# Altium schematic sheet Power_Management.SchDoc
size 420 x 297 mm; SheetNumber: 3; SheetTotal: 5
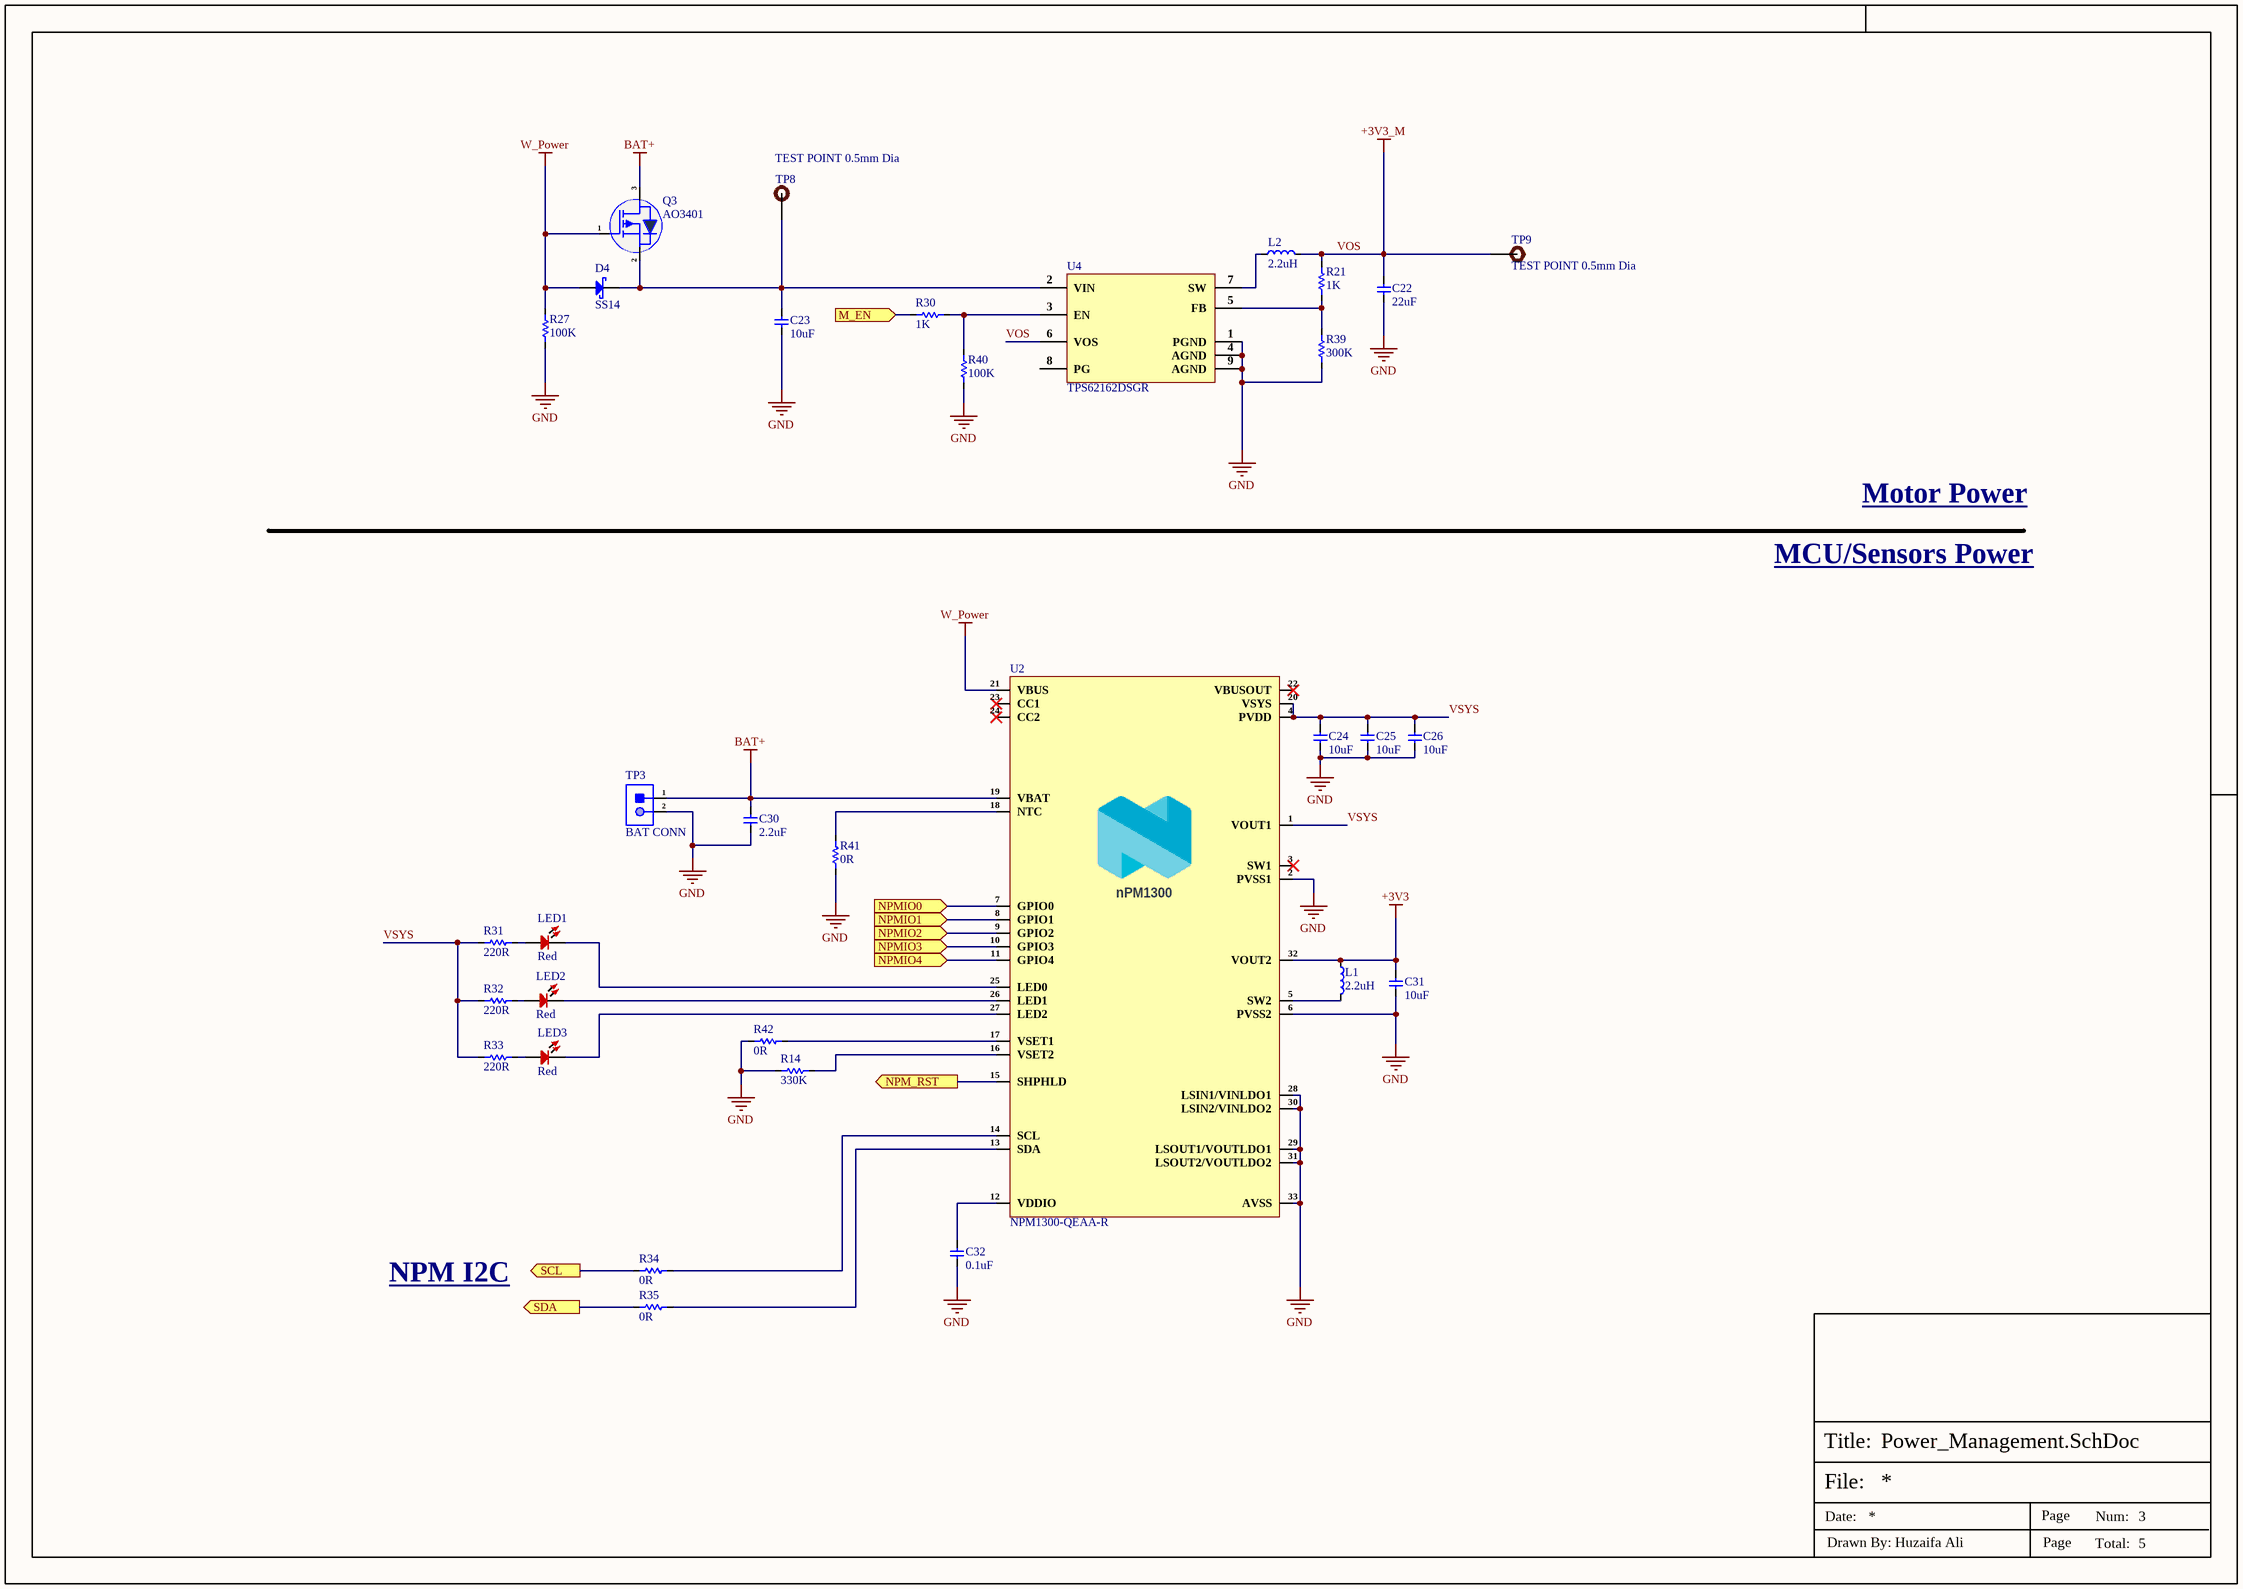
[diagram p0: Power_Management.SchDoc]

## Parts
C22  22uF  [Cap-0402]
C23  10uF  [Cap-0402]
C24  10uF  [Cap-0402]
C25  10uF  [Cap-0402]
C26  10uF  [Cap-0402]
C30  2.2uF  [Cap-0402]
C31  10uF  [Cap-0402]
C32  0.1uF  [Cap-0402]
D4  SS14  [SMA(DO-214AC)]
L1  2.2uH  [MAKK2016T2R2M_]
L2  2.2uH  [NR3015T2R2M]
LED1  Red  [LED-0402]
LED2  Red  [LED-0402]
LED3  Red  [LED-0402]
Q3  AO3401  [SOT-23]
R14  330K  [Res-0402]
R21  1K  [Res-0402]
R27  100K  [Res-0402]
R30  1K  [Res-0402]
R31  220R  [Res-0402]
R32  220R  [Res-0402]
R33  220R  [Res-0402]
R34  0R  [Res-0402]
R35  0R  [Res-0402]
R39  300K  [Res-0402]
R40  100K  [Res-0402]
R41  0R  [Res-0402]
R42  0R  [Res-0402]
TP3  BAT CONN  [2 Test Pad]  (no BOM)
TP8  TEST POINT 0.5mm Dia  [Test-point - 0.5mm]  (no BOM)
TP9  TEST POINT 0.5mm Dia  [Test-point - 0.5mm]  (no BOM)
U2  NPM1300-QEAA-R  [32-QFN (5x5)]
U4  TPS62162DSGR  [8-WSON(2x2)]

## Ports
M_EN (in, see MCU[3B]), NPM_RST (out, see MCU[4C]), NPMIO0 (in, see MCU[4B]), NPMIO1 (in, see MCU[4C]), NPMIO2 (in, see MCU[4C]), NPMIO3 (in, see MCU[4C]), NPMIO4 (in, see MCU[4B]), SCL (out, see IMU[3C], MCU[4B]), SDA (out, see IMU[3C], MCU[4B])

## Nets
+3V3: C31.2 L1.1 U2.32(VOUT2)
BAT+: C30.2 Q3.3(D) TP3.1 U2.19(VBAT)
GND: C22.1 C23.1 C24.1 C25.1 C26.1 C30.1 C31.1 C32.1 R14.1 R27.1 R39.1 R40.2 R41.1 R42.1 TP3.2 U2.2(PVSS1) U2.6(PVSS2) U2.28(LSIN1/VINLDO1) U2.29(LSOUT1/VOUTLDO1) U2.30(LSIN2/VINLDO2) U2.31(LSOUT2/VOUTLDO2) U2.33(AVSS) U4.1(PGND) U4.4(AGND) U4.9(AGND)
VOS: C22.2 L2.2 R21.2 TP9.1 U4.6(VOS)  [also labelled +3V3_M]
W_Power: D4.2(A) Q3.1(G) R27.2 U2.21(VBUS)
M_EN: R30.1 ; port M_EN
NPM_RST: U2.15(SHPHLD) ; port NPM_RST
NPMIO0: U2.7(GPIO0) ; port NPMIO0
NPMIO1: U2.8(GPIO1) ; port NPMIO1
NPMIO2: U2.9(GPIO2) ; port NPMIO2
NPMIO3: U2.10(GPIO3) ; port NPMIO3
NPMIO4: U2.11(GPIO4) ; port NPMIO4
SCL: R34.1 ; port SCL
SDA: R35.1 ; port SDA
VSYS: C24.2 C25.2 C26.2 R31.2 R32.2 R33.2 U2.1(VOUT1) U2.4(PVDD) U2.20(VSYS)
NetC23_2: C23.2 D4.1(K) Q3.2(S) TP8.1 U4.2(VIN)
NetC32_2: C32.2 U2.12(VDDIO)
NetL1_2: L1.2 U2.5(SW2)
NetL2_1: L2.1 U4.7(SW)
NetLED1_1: LED1.1 R31.1
NetLED1_2: LED1.2 U2.25(LED0)
NetLED2_1: LED2.1 R32.1
NetLED2_2: LED2.2 U2.26(LED1)
NetLED3_1: LED3.1 R33.1
NetLED3_2: LED3.2 U2.27(LED2)
NetR14_2: R14.2 U2.16(VSET2)
NetR21_1: R21.1 R39.2 U4.5(FB)
NetR30_2: R30.2 R40.1 U4.3(EN)
NetR34_2: R34.2 U2.14(SCL)
NetR35_2: R35.2 U2.13(SDA)
NetR41_2: R41.2 U2.18(NTC)
NetR42_2: R42.2 U2.17(VSET1)

Not connected (* = marked no-connect by the designer): U2 3(SW1)* 22(VBUSOUT)* 23(CC1)* 24(CC2)*; U4 8(PG)

## Notes on the sheet
- Motor Power
- MCU/Sensors Power
- NPM I2C
- File:
- Title:
- Date:
- Page
- Num:
- Total:
- Drawn By: Huzaifa Ali
- (in symbol NPM1300-QEAA-R) nPM1300

## Library data of the parts
C22 = GRM158R61A226ME15D: CAP CER 22UF 10V X5R 0402; Manufacturer: Murata; Material: 4241ConductorMaterial; Dielectric: 1537DielectricType; Tolerance: 20%; Item Type: Capacitor; Supplier: Mouser; Supplier Part Number: 81-GRM158R61A226ME5D; Manufacturer Part Number: GRM158R61A226ME15D; RoHS: Yes; Stock: 328944; Pricing: 1=0.46, 10=0.225, 50=0.225, 100=0.146, 1000=0.124, 10000=0.106 (USD); Case/Package: 343Case; Min Operating Temperature: -55°C; Max Operating Temperature: 85°C; Value: 22uF; Voltage Rating: 10V; Voltage Rating (DC): 10V; Length: 1mm; Width: 500um; Height: 800um; Thickness: 800um; LCSC Part Number: C3845593; Category: Ceramic Capacitors
C23-C26 C31 = CC0402MRX5R6BB106: CAP CER 10UF 10V X5R 0402; Manufacturer: Yageo; Tolerance: 20%; Item Type: Capacitor; Supplier 1: Future Electronics; Manufacturer Part Number: CC0402MRX5R6BB106; RoHS: Yes; Category: Ceramic Capacitors; Stock 1: 80000; Pricing 1: 10000=0.02650, 20000=0.02590, 30000=0.02550, 40000=0.02530, 50000=0.02450 (USD); Mount: Surface Mount; Case/Package: 0402; Case Code (Imperial): 0402; Case Code (Metric): 1005; Min Operating Temperature: -55°C; Max Operating Temperature: 85°C; Packaging: Tape and Reel; Capacitance: 10uF; Voltage Rating: 10V; RoHS Compliant: Yes; ComponentLink1URL: http://www.yageo.com/documents/recent/UPY-GPHC_X5R_4V-to-50V_25.pdf?src-supplier=Digi-Key; ComponentLink1Description: http://www.yageo.com/documents/recent/UPY-GPHC_X5R_4V-to-50V_25.pdf?src-supplier=Digi-Key; Supplier Part Number 1: 6097631; LCSC Part Number: C962143
C30 = C1005X5R1V225K050BC: CAP CER 2.2UF 35V X5R 0402; Manufacturer: TDK; Item Type: Capacitors; Dielectric Material: Ceramic; Material: 4241ConductorMaterial; Tolerance: 10%; Supplier: Digikey; Supplier Part Number: 445-9028-1-ND; Manufacturer Part Number: C1005X5R1V225K050BC; RoHS: Yes; Stock: 1458755; Pricing: 1=0.21, 10=0.123, 50=0.0866, 100=0.0754, 500=0.05646, 1000=0.05055, 2500=0.04429, 5000=0.04049 (USD); Mounting Technology: Surface Mount; Case/Package: 0402; Case Code (Imperial): 0402; Case Code (Metric): 1005; Weight: 2.3E-05oz; Min Operating Temperature: -55°C; Max Operating Temperature: 85°C; Packaging: Tape and Reel; Voltage Rating: 35V; Value: 2.2uF; Voltage Rating (DC): 35V; Package Quantity: 1; Dielectric: X5R; Termination: SMD/SMT; Series: C; Length: 1mm; Width: 0.02inch; Height: 0.5mm; Thickness: 0.022inch; Depth: 0.5mm; Lead Free: Lead Free; RoHS Compliant: Yes; Reach SVHC Compliant: Unknown; ComponentLink1URL: https://datasheet.ciiva.com/24218/mlcc-commercial-general-en-24218938.pdf?src-supplier=Mouser; ComponentLink1Description: https://datasheet.ciiva.com/24218/mlcc-commercial-general-en-24218938.pdf?src-supplier=Mouser
C32 = C1005X5R1H104K050BB: CAP CER 0.1UF 50V X5R 0402; Manufacturer: TDK; Dielectric Material: Ceramic; Capacitance: 100nF; Tolerance: 10%; Item Type: Capacitor; Supplier 1: Digi-Key; Manufacturer Part Number: C1005X5R1H104K050BB; Stock 1: 1455182; Pricing 1: 1=0.12, 10=0.09, 50=0.049, 100=0.04, 500=0.02858, 1000=0.02245, 2500=0.02041, 5000=0.01878 (USD); Mount: Surface Mount; Case/Package: 0402; Case Code (Metric): 1005; Case Code (Imperial): 0402; Weight: 2.3E-05oz; Min Operating Temperature: -55°C; Max Operating Temperature: 85°C; Dielectric: X5R; Voltage Rating: 50V; Packaging: Tape and Reel; Voltage Rating (DC): 50V; Termination: SMD/SMT; Construction: Flat; Package Quantity: 1; Resistor Type: Ceramic; Voltage: 50V; Series: C; Length: 1mm; Width: 0.02inch; Height: 0.5mm; Depth: 0.5mm; Thickness: 0.022inch; Radiation Hardening: No; Lead Free: Lead Free; REACH SVHC: No SVHC; RoHS Compliant: Yes; ComponentLink1URL: https://product.tdk.com/info/en/catalog/spec/mlccspec_commercial_general_midvoltage_en.pdf?src-supplier=Digi-Key; ComponentLink1Description: https://product.tdk.com/info/en/catalog/spec/mlccspec_commercial_general_midvoltage_en.pdf?src-supplier=Digi-Key; ComponentLink2URL: http://www.tdk.co.jp/tefe02/e413_c.pdf?src-supplier=Future+Electronics; ComponentLink2Description: http://www.tdk.co.jp/tefe02/e413_c.pdf?src-supplier=Future+Electronics; ComponentLink3URL: https://www.verical.com/server-webapp/html/getDatasheet?partID=743571&src-supplier=Verical; ComponentLink3Description: https://www.verical.com/server-webapp/html/getDatasheet?partID=743571&src-supplier=Verical; ComponentLink4URL: http://www.tdk.co.jp/tefe02/e412_c.pdf?src-supplier=Avnet+Europe; ComponentLink4Description: http://www.tdk.co.jp/tefe02/e412_c.pdf?src-supplier=Avnet+Europe; Supplier Part Number 1: 445-5942-1-ND; LCSC Part Number: C2181865
D4 = SS14: 40V Independent Type 1A 550mV@1A SMA(DO-214AC) Schottky Diodes ROHS; Manufacturer: MDD(Microdiode Semiconductor); Item Type: Diode; Manufacturer Part Number: SS14; Package: SMA(DO-214AC); LCSC Part Number: C2480; ComponentLink1Description: LCSC; ComponentLink1URL: https://www.lcsc.com/product-detail/Schottky-Diodes_MDD-Microdiode-Semiconductor-SS14_C2480.html?s_z=n_C2480
L1 = MAKK2016T2R2M: FIXED IND 2.2UH 1.5A 160MOHM SMD; Manufacturer: Taiyo Yuden; Core Material: Metal; Tolerance: 20%; Shielding: Shielded; DC Resistance (DCR): 160mR; Test Frequency: 2MHz; Item Type: Inductor; Supplier 1: Mouser; Manufacturer Part Number: MAKK2016T2R2M; RoHS: Yes; Category: Fixed Inductors; Stock 1: 64320; Pricing 1: 1=0.27000, 10=0.17200, 50=0.17200, 100=0.14000, 1000=0.10600, 10000=0.09200 (USD); Mount: Surface Mount; Case/Package: 0806; Case Code (Metric): 2016; Case Code (Imperial): 0806; Min Operating Temperature: -40°C; Max Operating Temperature: 105°C; Packaging: Tape and Reel; Package Quantity: 3000; Resistor Type: Wirewound; Inductance: 2.2uH; Current Rating: 1.5A; Saturation Current: 1.5A; Max DC Current: 1.5A; Termination: SMD/SMT; Length: 0.079inch; Width: 0.063inch; Height: 1mm; Height - Seated (Max): 0.039inch; Depth: 1.6mm; Radiation Hardening: No; Halogen Free: Halogen Free; RoHS Compliant: Yes; ComponentLink1URL: https://datasheet.ciiva.com/30014/makk2016t2r2m-ss-30014449.pdf?src-supplier=Avnet; ComponentLink1Description: https://datasheet.ciiva.com/30014/makk2016t2r2m-ss-30014449.pdf?src-supplier=Avnet; Supplier Part Number 1: 963-MAKK2016T2R2M; LCSC Part Number: C92923
L2 = NR3015T2R2M: FIXED IND 2.2UH 1.5A 72 MOHM SMD; Manufacturer: Taiyo Yuden; Item Type: Inductor; Core Material: Ferrite; Self Resonant Frequency: 64MHz; Shielding: Shielded; Current Rating: 1.48A; Inductance Tolerance: 20%; DC Resistance (DCR): 72mR; Test Frequency: 100kHz; Supplier: Digikey; LCSC Part Number: C86423; Manufacturer Part Number: NR3015T2R2M; RoHS: Yes; Stock: 131557; Pricing: 1=0.32, 10=0.263, 25=0.2424, 50=0.2222, 100=0.1959, 250=0.18988, 500=0.16968, 1000=0.13736 (USD); Case/Package: 3015; Pins: 2; Min Operating Temperature: -25°C; Max Operating Temperature: 120°C; Packaging: Tape and Reel; Value: 2.2uH; Package Quantity: 1; Saturation Current: 1.48A; Tolerance: 20%; Max DC Current: 1.5A; Termination: SMD/SMT; RMS Current (Irms): 1.5A; Series: NR; ESR: 72mR; Length: 0.118inch; Width: 0.118inch; Height: 1.5mm; Height - Seated (Max): 0.059inch; Halogen Free: Halogen Free; Lead Free: Lead Free; Reach SVHC Compliant: Unknown; RoHS Compliant: Yes; ComponentLink1URL: https://datasheet.ciiva.com/8002/1734585-8002131.pdf?src-supplier=Element14; ComponentLink1Description: https://datasheet.ciiva.com/8002/1734585-8002131.pdf?src-supplier=Element14; ComponentLink2URL: https://datasheet.ciiva.com/8002/nr3015t2r2m-ss-8002130.pdf?src-supplier=Element14; ComponentLink2Description: https://datasheet.ciiva.com/8002/nr3015t2r2m-ss-8002130.pdf?src-supplier=Element14; ComponentLink3URL: https://datasheet.ciiva.com/8499/nr3015t2r2m-ss-8499257.pdf?src-supplier=Avnet; ComponentLink3Description: https://datasheet.ciiva.com/8499/nr3015t2r2m-ss-8499257.pdf?src-supplier=Avnet; ComponentLink4URL: https://datasheet.ciiva.com/15988/279nr3015t2r2m-15988078.pdf?src-supplier=Onlinecomponents.com; ComponentLink4Description: https://datasheet.ciiva.com/15988/279nr3015t2r2m-15988078.pdf?src-supplier=Onlinecomponents.com; ComponentLink5URL: https://datasheet.ciiva.com/1043/wound04-e-1043235.pdf?src-supplier=Digikey; ComponentLink5Description: https://datasheet.ciiva.com/1043/wound04-e-1043235.pdf?src-supplier=Digikey; ComponentLink6URL: https://datasheet.ciiva.com/1043/wound04-e-1043234.pdf?src-supplier=Digikey; ComponentLink6Description: https://datasheet.ciiva.com/1043/wound04-e-1043234.pdf?src-supplier=Digikey; ComponentLink7URL: https://datasheet.ciiva.com/1043/wound04-e-1043236.pdf?src-supplier=Digikey; ComponentLink7Description: https://datasheet.ciiva.com/1043/wound04-e-1043236.pdf?src-supplier=Digikey
LED1-LED3 = XZMDK68W-2: LED RED CLEAR CHIP SMD; Manufacturer: SunLED; Lens Color: Colorless; Luminous Intensity: 69mcd; Test Current: 20mA; Viewing Angle: 120°; Dominant Wavelength: 630nm; Forward Voltage: 1.95V; Supplier 1: Digi-Key; Manufacturer Part Number: XZMDK68W-2; Stock 1: 69539; Pricing 1: 1=0.43, 10=0.306, 100=0.136, 500=0.0952, 1000=0.0782 (USD); Mount: Surface Mount; Case/Package: 0402; Color: Red; Case Code (Metric): 1005; Case Code (Imperial): 0402; Packaging: Tape and Reel; Lens Transparency: Clear; Length: 1mm; Height: 0.6mm; Width: 0.5mm; ComponentLink1URL: http://www.sunledusa.com/products/spec/XZMDK68W-2.pdf?src-supplier=Digi-Key; ComponentLink1Description: http://www.sunledusa.com/products/spec/XZMDK68W-2.pdf?src-supplier=Digi-Key; ComponentLink2URL: https://www.sunledusa.com/products/spec/XZMDK68W-2.pdf?src-supplier=Digi-Key; ComponentLink2Description: https://www.sunledusa.com/products/spec/XZMDK68W-2.pdf?src-supplier=Digi-Key; Supplier Part Number 1: 1497-1174-6-ND; Item Type: LED
Q3 = AO3401: Trans Mosfet P-ch 30V 4A 3-PIN SOT-23 T/r; Manufacturer: Alpha & Omega Semiconductor; Manufacturer Part Number: AO3401A; Rds On Max: 44mR; Input Capacitance: 1.2nF; Max Power Dissipation: 1.4W; Number of Elements: 1; Supplier 1: Arrow Electronics; RoHS: Yes; Category: MOSFETs; Mount: Surface Mount; Case/Package: TO-236-3; Number of Pins: 3; Min Operating Temperature: -55°C; Max Operating Temperature: 150°C; Packaging: Tape and Reel; Drain to Source Voltage (Vdss): 30V; Continuous Drain Current (ID): 4A; Power Dissipation: 1.4W; Series: -; Radiation Hardening: No; RoHS Compliant: Yes; Lead Free: Lead Free; ComponentLink1URL: https://datasheet.ciiva.com/940/ao3401a-940720.pdf?src-supplier=Digi-Key; ComponentLink1Description: https://datasheet.ciiva.com/940/ao3401a-940720.pdf?src-supplier=Digi-Key; ComponentLink2URL: https://datasheet.ciiva.com/26927/getdatasheetpartid-79048-26927888.pdf?src-supplier=Verical; ComponentLink2Description: https://datasheet.ciiva.com/26927/getdatasheetpartid-79048-26927888.pdf?src-supplier=Verical; Supplier Part Number 1: AO3401A; LCSC Part Number: C181091; Item Type: Mosfet
R14 = CRCW0402330KFKEDC: RES 330K OHM 1% 1/16W 0402; Manufacturer: Vishay; Power Rating: 63mW; Value: 330kR; Item Type: Resistor; Supplier: Mouser; Supplier Part Number: 71-CRCW0402330KFKEDC; Manufacturer Part Number: CRCW0402330KFKEDC; RoHS: Yes; Category: Chip SMD Resistors; Stock: 34154; Pricing: 1=0.1, 10=0.017, 50=0.017, 100=0.008, 1000=0.005, 10000=0.004 (USD); Case/Package: 0402; Tolerance: 1%; Lead Free: Lead Free; RoHS Compliant: Yes; LCSC Part Number: C3009051
R21 R30 = CRCW04021K00JNED: RES SMD 1K OHM 5% 1/16W 0402; Manufacturer: Vishay Dale; Item Type: Resistors; Power Rating: 63mW; Value: 1kR; Temperature Coefficient: 200ppm/°C; Voltage Rating: 50V; Supplier: Mouser; LCSC Part Number: C191588; Manufacturer Part Number: CRCW04021K00JNED; RoHS: Yes; Stock: 2955; Pricing: 1=0.1, 10=0.016, 50=0.016, 100=0.012, 1000=0.007, 10000=0.003 (USD); Case/Package: 0402; Pins: 2; Case Code (Imperial): 0402; Case Code (Metric): 1005; Weight: 2.3E-05oz; Contact Plating: Tin; Min Operating Temperature: -55°C; Max Operating Temperature: 155°C; Packaging: Tape and Reel; Tolerance: 5%; Package Quantity: 1; Termination: SMD/SMT; Number of Terminations: 2; Max Power Dissipation: 63mW; Features: Automotive AEC-Q200; Series: CRCW; Technology: THICK FILM; Resistor Type: Thick Film; Working Voltage: 50V; Resistance Tolerance: 5%; Construction: Rectangular; Voltage Rating (DC): 50V; Length: 1mm; Width: 0.02inch; Height: 0.016inch; Depth: 0.5mm; Ratings: AEC-Q200; Radiation Hardening: No; Lead Free: 5697LeadFree; RoHS Compliant: Yes; Military Standard: Not; Reach SVHC Compliant: Unknown; ComponentLink1URL: https://datasheet.ciiva.com/28621/1847332-28621342.pdf?src-supplier=Element14; ComponentLink1Description: https://datasheet.ciiva.com/28621/1847332-28621342.pdf?src-supplier=Element14; ComponentLink2URL: https://datasheet.ciiva.com/2462/dcrcwe3-2462077.pdf?src-supplier=Digikey; ComponentLink2Description: https://datasheet.ciiva.com/2462/dcrcwe3-2462077.pdf?src-supplier=Digikey; ComponentLink3URL: https://datasheet.ciiva.com/2462/dcrcwe3-2462078.pdf?src-supplier=Digikey; ComponentLink3Description: https://datasheet.ciiva.com/2462/dcrcwe3-2462078.pdf?src-supplier=Digikey; ComponentLink4URL: https://datasheet.ciiva.com/16199/dcrcwe3-16199256.pdf?src-supplier=Future+Electronics; ComponentLink4Description: https://datasheet.ciiva.com/16199/dcrcwe3-16199256.pdf?src-supplier=Future+Electronics; ComponentLink5URL: https://datasheet.ciiva.com/2462/dcrcwe3-2462076.pdf?src-supplier=Digikey; ComponentLink5Description: https://datasheet.ciiva.com/2462/dcrcwe3-2462076.pdf?src-supplier=Digikey; ComponentLink6URL: https://datasheet.ciiva.com/7743/dcrcwe3-7743478.pdf?src-supplier=Element14; ComponentLink6Description: https://datasheet.ciiva.com/7743/dcrcwe3-7743478.pdf?src-supplier=Element14; ComponentLink7URL: https://datasheet.ciiva.com/16778/70201119-16778053.pdf?src-supplier=Allied+Electronics; ComponentLink7Description: https://datasheet.ciiva.com/16778/70201119-16778053.pdf?src-supplier=Allied+Electronics; ComponentLink8URL: https://datasheet.ciiva.com/5545/dcrcwe3-109170-5545913.pdf?src-supplier=Mouser; ComponentLink8Description: https://datasheet.ciiva.com/5545/dcrcwe3-109170-5545913.pdf?src-supplier=Mouser
R27 R40 = RC0402FR-07100KL: RES 100K OHM 1% 1/16W 0402; Manufacturer: Yageo; Resistance: 100kR; Temperature Coefficient: 100ppm/°C; Power Rating: 63mW; Voltage Rating: 50V; Item Type: Resistor; Supplier 1: Mouser; Manufacturer Part Number: RC0402FR-07100KL; RoHS: Yes; Category: Chip SMD Resistors; Stock 1: 7759549; Pricing 1: 1=0.10000, 10=0.01200, 50=0.01200, 100=0.00500, 1000=0.00300, 2500=0.00200, 10000=0.00100 (USD); Case/Package: 0402; Case Code (Metric): 1005; Case Code (Imperial): 0402; Min Operating Temperature: -55°C; Max Operating Temperature: 155°C; Resistor Type: Thick Film; Tolerance: 1%; Packaging: Tape and Reel; Package Quantity: 1; Number of Terminations: 2; Termination: SMD/SMT; Max Power Dissipation: 63mW; Working Voltage: 50V; Features: Moisture Resistant; Series: RC; Resistance Tolerance: 1%; Construction: Rectangular; Technology: THICK FILM; Length: 0.039inch; Width: 0.02inch; Height: 0.016inch; Depth: 0.5mm; REACH SVHC: No SVHC; Lead Free: Lead Free; RoHS Compliant: Yes; Military Standard: Not; ComponentLink1URL: https://datasheet.ciiva.com/11819/0900766b80c66297-11819452.pdf?src-supplier=RSComponents; ComponentLink1Description: https://datasheet.ciiva.com/11819/0900766b80c66297-11819452.pdf?src-supplier=RSComponents; ComponentLink2URL: https://datasheet.ciiva.com/22747/1018594-22747509.pdf?src-supplier=Element14; ComponentLink2Description: https://datasheet.ciiva.com/22747/1018594-22747509.pdf?src-supplier=Element14; ComponentLink3URL: https://datasheet.ciiva.com/2453/pyu-r-int-thick-7-2453362.pdf?src-supplier=Digi-Key; ComponentLink3Description: https://datasheet.ciiva.com/2453/pyu-r-int-thick-7-2453362.pdf?src-supplier=Digi-Key; ComponentLink4URL: https://datasheet.ciiva.com/2453/pyu-r-int-thick-7-2453363.pdf?src-supplier=Digi-Key; ComponentLink4Description: https://datasheet.ciiva.com/2453/pyu-r-int-thick-7-2453363.pdf?src-supplier=Digi-Key; ComponentLink5URL: https://datasheet.ciiva.com/2453/pyu-r-int-thick-7-2453361.pdf?src-supplier=Digi-Key; ComponentLink5Description: https://datasheet.ciiva.com/2453/pyu-r-int-thick-7-2453361.pdf?src-supplier=Digi-Key; ComponentLink6URL: https://datasheet.ciiva.com/12667/pyu-rc0402-51-rohs-l-6-r-12667930.pdf?src-supplier=Mouser; ComponentLink6Description: https://datasheet.ciiva.com/12667/pyu-rc0402-51-rohs-l-6-r-12667930.pdf?src-supplier=Mouser; ComponentLink7URL: https://datasheet.ciiva.com/15189/getdatasheetpartid-323696-15189334.pdf?src-supplier=Verical; ComponentLink7Description: https://datasheet.ciiva.com/15189/getdatasheetpartid-323696-15189334.pdf?src-supplier=Verical; Supplier Part Number 1: 603-RC0402FR-07100KL; LCSC Part Number: C60491
R31-R33 = RC0402FR-07220RL: RES 220 OHM 1% 1/16W 0402; Manufacturer: Yageo; Item Type: Resistors; Power Rating: 62.5mW; Voltage Rating: 50V; Temperature Coefficient: 100ppm/°C; Max Power Dissipation: 63mW; Supplier: Digikey; LCSC Part Number: C112291; Manufacturer Part Number: RC0402FR-07220RL; RoHS: Yes; Stock: 225544; Pricing: 1=0.1, 10=0.007, 100=0.0061, 1000=0.0051, 2500=0.00408 (USD); Case/Package: 0402; Pins: 2; Case Code (Imperial): 0402; Case Code (Metric): 1005; Min Operating Temperature: -55°C; Max Operating Temperature: 155°C; Value: 220R; Tolerance: 1%; Packaging: Tape and Reel; Voltage Rating (DC): 50V; Package Quantity: 1; Termination: SMD/SMT; Resistor Type: Thick Film; Number of Terminations: 2; Features: Moisture Resistant; Series: RC; Resistance Tolerance: 1%; Construction: Rectangular; Technology: THICK FILM; Voltage Rating (AC): 50V; Length: 0.039inch; Width: 0.02inch; Height: 0.016inch; Depth: 0.5mm; Reach SVHC Compliant: No; Military Standard: Not; RoHS Compliant: Yes; Lead Free: 5697LeadFree; ComponentLink1URL: https://datasheet.ciiva.com/2453/pyu-r-int-thick-7-2453461.pdf?src-supplier=Digikey; ComponentLink1Description: https://datasheet.ciiva.com/2453/pyu-r-int-thick-7-2453461.pdf?src-supplier=Digikey
R34 R35 R41 R42 = RC0402FR-070RL: RES 0 OHM JUMPER 1/16W 0402; Manufacturer: Yageo; Item Type: Resistors; Tolerance: 1%; Power Rating: 62.5mW; Voltage Rating: 50V; Temperature Coefficient: 200ppm/°C; Max Power Dissipation: 63mW; Supplier 1: Mouser; Manufacturer Part Number: RC0402FR-070RL; RoHS: Yes; Stock 1: 8556842; Pricing 1: 1=0.10000, 10=0.01400, 50=0.01400, 100=0.00600, 1000=0.00300, 5000=0.00200, 10000=0.00100 (USD); Mount: Surface Mount; Case/Package: 0402; Contact Plating: Tin,Matte; Case Code (Imperial): 0402; Case Code (Metric): 1005; Size Code: 0402; Min Operating Temperature: -55°C; Max Operating Temperature: 155°C; Resistance: 0R; Resistor Type: Thick Film; Packaging: Tape and Reel; Termination: SMD/SMT; Features: Moisture Resistant; Series: RC; Number of Terminations: 2; Length: 1mm; Width: 0.5mm; Height: 0.35mm; Radiation Hardening: No; Lead Free: Lead Free; RoHS Compliant: Yes; ComponentLink1URL: https://datasheet.ciiva.com/8896/pyu-rc0402-51-rohs-l-6-8896149.pdf?src-supplier=Avnet; ComponentLink1Description: https://datasheet.ciiva.com/8896/pyu-rc0402-51-rohs-l-6-8896149.pdf?src-supplier=Avnet; ComponentLink2URL: https://datasheet.ciiva.com/16790/pyu-rc0402-51-rohs-l-6-r-16790444.pdf?src-supplier=Future+Electronics; ComponentLink2Description: https://datasheet.ciiva.com/16790/pyu-rc0402-51-rohs-l-6-r-16790444.pdf?src-supplier=Future+Electronics; Supplier Part Number 1: 603-RC0402FR-070RL; LCSC Part Number: C106231
R39 = RCS0402300KFKED: RES SMD 300K OHM 1% 1/5W 0402; Manufacturer: Vishay Dale; Resistance: 300kR; Max Power Dissipation: 200mW; Temperature Coefficient: 100ppm/°C; Supplier 1: Digi-Key; Manufacturer Part Number: RCS0402300KFKED; Stock 1: 9042; Pricing 1: 1=0.12, 10=0.105, 100=0.0402, 1000=0.01771, 2500=0.0153, 5000=0.01368 (USD); Case/Package: 0402; Min Operating Temperature: -55°C; Max Operating Temperature: 155°C; Package Quantity: 10000; Packaging: Tape and Reel; Resistor Type: Thick Film; Number of Terminations: 2; Tolerance: 1%; Features: Automotive AEC-Q200; Length: 0.039inch; Width: 0.02inch; Height: 0.016inch; RoHS Compliant: Yes; ComponentLink1URL: http://www.vishay.com/docs/20065/rcse3.pdf?src-supplier=Digi-Key; ComponentLink1Description: http://www.vishay.com/docs/20065/rcse3.pdf?src-supplier=Digi-Key; Supplier Part Number 1: 541-RCS0402300KFKEDDKR-ND; LCSC Part Number: C1881124
TP3 = 2 Test Pad: Wire Connecting Pad; Item Type: Test Point; Manufacturer Part Number: 2 Test Pad
TP8 TP9 = TEST POINT 0.5mm Dia: Test Point ON; Item Type: Test Point; Manufacturer Part Number: TEST POINT 0.5mm Dia
U2 = NPM1300-QEAA-R: PMIC (POWER MANAGEMENT IC) WITH; Manufacturer: Nordic Semiconductor; Manufacturer Part Number: NPM1300-QEAA-R7; Supplier: Digikey; Supplier Part Number: 4823-NPM1300-QEAA-R7DKR-ND; RoHS: No; Item Type: IC; Stock: 2826; Pricing: 1=4.13, 100=3.23, 500=2.55, 1000=2.22001 (USD)
U4 = TPS62162DSGR: Buck Switching Regulator IC Positive Fixed 3.3V 1 Output 1A 8-WFDFN Exposed Pad; Manufacturer: Texas Instruments; Number of Outputs: 1; Max Input Voltage: 17V; Min Input Voltage: 3V; Switching Frequency: 2.25MHz; Synchronous Rectifier: Yes; Quiescent Current: 17uA; Supplier 1: Mouser; Manufacturer Part Number: TPS62162DSGR; RoHS: Yes; Category: Voltage Regulators - Switching; Pricing 1: 1=1.59000, 10=1.44000, 25=1.36000, 50=1.36000, 100=1.16000, 250=1.09000, 500=0.94700, 1000=0.78500, 10000=0.78400 (USD); Case/Package: SOIC; Number of Pins: 8; Contact Plating: Gold; Min Operating Temperature: -40°C; Max Operating Temperature: 125°C; Output Voltage: 3.3V; Packaging: Tape and Reel; Output Current: 1A; Package Quantity: 3000; Max Output Current: 1A; Min Output Voltage: 3.3V; Max Output Voltage: 3.3V; Operating Supply Voltage: 17V; Output Type: Fixed; Output Configuration: Positive; Series: DCS-Control™; Radiation Hardening: No; Lead Free: Lead Free; RoHS Compliant: Yes; ComponentLink1URL: https://datasheet.ciiva.com/2034/tps62161-2034675.pdf?src-supplier=Digi-Key; ComponentLink1Description: https://datasheet.ciiva.com/2034/tps62161-2034675.pdf?src-supplier=Digi-Key; Supplier Part Number 1: 595-TPS62162DSGR; LCSC Part Number: C40256; Item Type: IC